# Altium project noeud_capteur_CWSB.PrjPcb
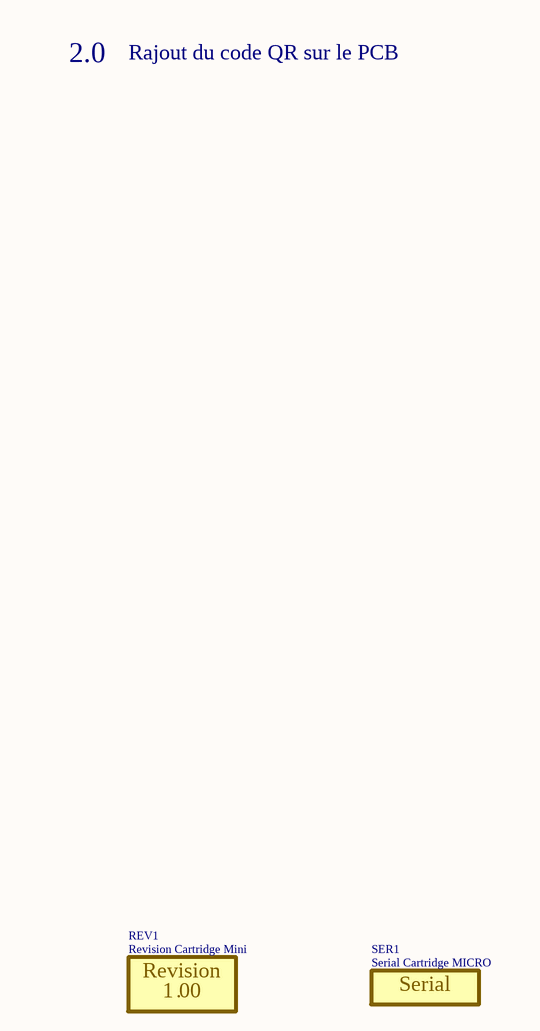
[diagram p0: NC_Title.SchDoc]
Projet_Concepteur1: William Champagne; Projet_Concepteur2: Bruno Savard; Projet_Date: 2026-08-24; Projet_nom_du_cours: CI3 (243-554-SH); Projet_PCB_Rev: 1; Projet_SCH_Rev: 00; Projet_stencil_Bot_epaisseur: 0.1 MM; Projet_stencil_Top_epaisseur: 0.1 MM; Projet_Titre: Noeud_capteurs_CWSB
5 sheets, 62 parts. Net scope: flat (ports and power ports of the same name join across sheets).
Board file: NC_PCB_4L.PcbDoc
Sheets:
  NC_Title.SchDoc
  NC_Overview.SchDoc
  NC_Connectors.SchDoc
  NC_Circuit.SchDoc
  NC_Alimentation.SchDoc

## Sheet NC_Title.SchDoc
size Tabloid; Date: Date; Author: Author 1; Revision: 1; SheetNumber: 1; SheetTotal: 5; Size: 11x17; Sheet_Name: Sheet Description

### Parts
REV1  Revision Cartridge Mini  [REV_REVISION_CARTRIDGE_MINI]  (no BOM)
SER1  Serial Cartridge MICRO  [SER_SERIAL_CARTRIDGE_MICRO]  (no BOM)

### Notes on the sheet
- 2.0
- Rajout du code QR sur le PCB
- Projet initial
- Historique de révision
- 1.0
- Légende
- Conversion des boitiers
- Notes Générales
- Métrique
- 1005
- 1608
- Impérial
- 0402
- 0603
- Revision
- .
- Notes PCB
- 2012
- 3216
- 0805
- 1206
- Notes Programmation
- 3225
- 6432
- 1210
- 2512
- Date :
- Variants
- RÉVISION & NUMÉRO DE SÉRIE
- Titre du projet
- Cours associé au projet
- Taille
- Département
- Technologies du
- Révision
- PCB
- SCH
- Date
- génie électrique
- Feuille
- Variant
- de
- Concepteurs
- (in symbol REV_REVISION_CARTRIDGE_MINI) Revision; .
- (in symbol SER_SERIAL_CARTRIDGE_MICRO) Serial

### Library data of the parts
REV1 = REV_REVISION_CARTRIDGE_MINI: REV - REVISION CARTRIDGE MINI; Rule: UNIONINDEX=0|RULEKIND=ComponentClearance|NETSCOPE=AnyNet|LAYERKIND=SameLayer|NAME=Schematic Component Clearance Constraint|GAP=0mil|COLLISIONCHECKMODE=3|VERTICALGAP=0mil|SHOWDISTANCES=FALSE|UNIT=Imperial; Rule: UNIONINDEX=0|RULEKIND=Clearance|NETSCOPE=DifferentNets|LAYERKIND=SameLayer|NAME=Schematic Clearance Constraint|GAP=10mil|GENERICCLEARANCE=10mil|IGNOREPADTOPADCLEARANCEINFOOTPRINT=FALSE|OBJECTCLEARANCES=ClearanceObj_Arc-ClearanceObj_Text:0;ClearanceObj_Track-ClearanceObj_Text:0;ClearanceObj_Text-ClearanceObj_Text:0|UNIT=Imperial; Value: *; Power Max: *; HelpURL: *; Package: *; Manufacturer #1: *; Note: *; Assembly Type: NONE; Part Number #1: *; Polarized: *; Supplier 1: *; Supplier Part Number 1: *
SER1 = SER_SERIAL_CARTRIDGE_MICRO: SER - SERIAL CARTRIDGE MICRO; Rule: UNIONINDEX=0|RULEKIND=ComponentClearance|NETSCOPE=AnyNet|LAYERKIND=SameLayer|NAME=Schematic Component Clearance Constraint|GAP=0mil|COLLISIONCHECKMODE=3|VERTICALGAP=0mil|SHOWDISTANCES=FALSE|UNIT=Imperial; Rule: UNIONINDEX=0|RULEKIND=Clearance|NETSCOPE=DifferentNets|LAYERKIND=SameLayer|NAME=Schematic Clearance Constraint|GAP=10mil|GENERICCLEARANCE=10mil|IGNOREPADTOPADCLEARANCEINFOOTPRINT=FALSE|OBJECTCLEARANCES=ClearanceObj_Arc-ClearanceObj_Text:0;ClearanceObj_Track-ClearanceObj_Text:0;ClearanceObj_Text-ClearanceObj_Text:0|UNIT=Imperial; Value: *; Power Max: *; HelpURL: *; Package: *; Manufacturer #1: *; Note: *; Assembly Type: NONE; Part Number #1: *; Polarized: *; Supplier 1: *; Supplier Part Number 1: *

## Sheet NC_Overview.SchDoc
size Tabloid; Date: Date; Author: Author 1; Revision: 1; SheetNumber: 2; SheetTotal: 5; Size: 11x17; Sheet_Name: Schéma fonctionnel

### Notes on the sheet
- Nom de la feuille
- Titre du projet
- Cours associé au projet
- Taille
- Département
- Technologies du
- Révision
- PCB
- .
- SCH
- Date
- génie électrique
- Feuille
- Variant
- de
- Concepteurs
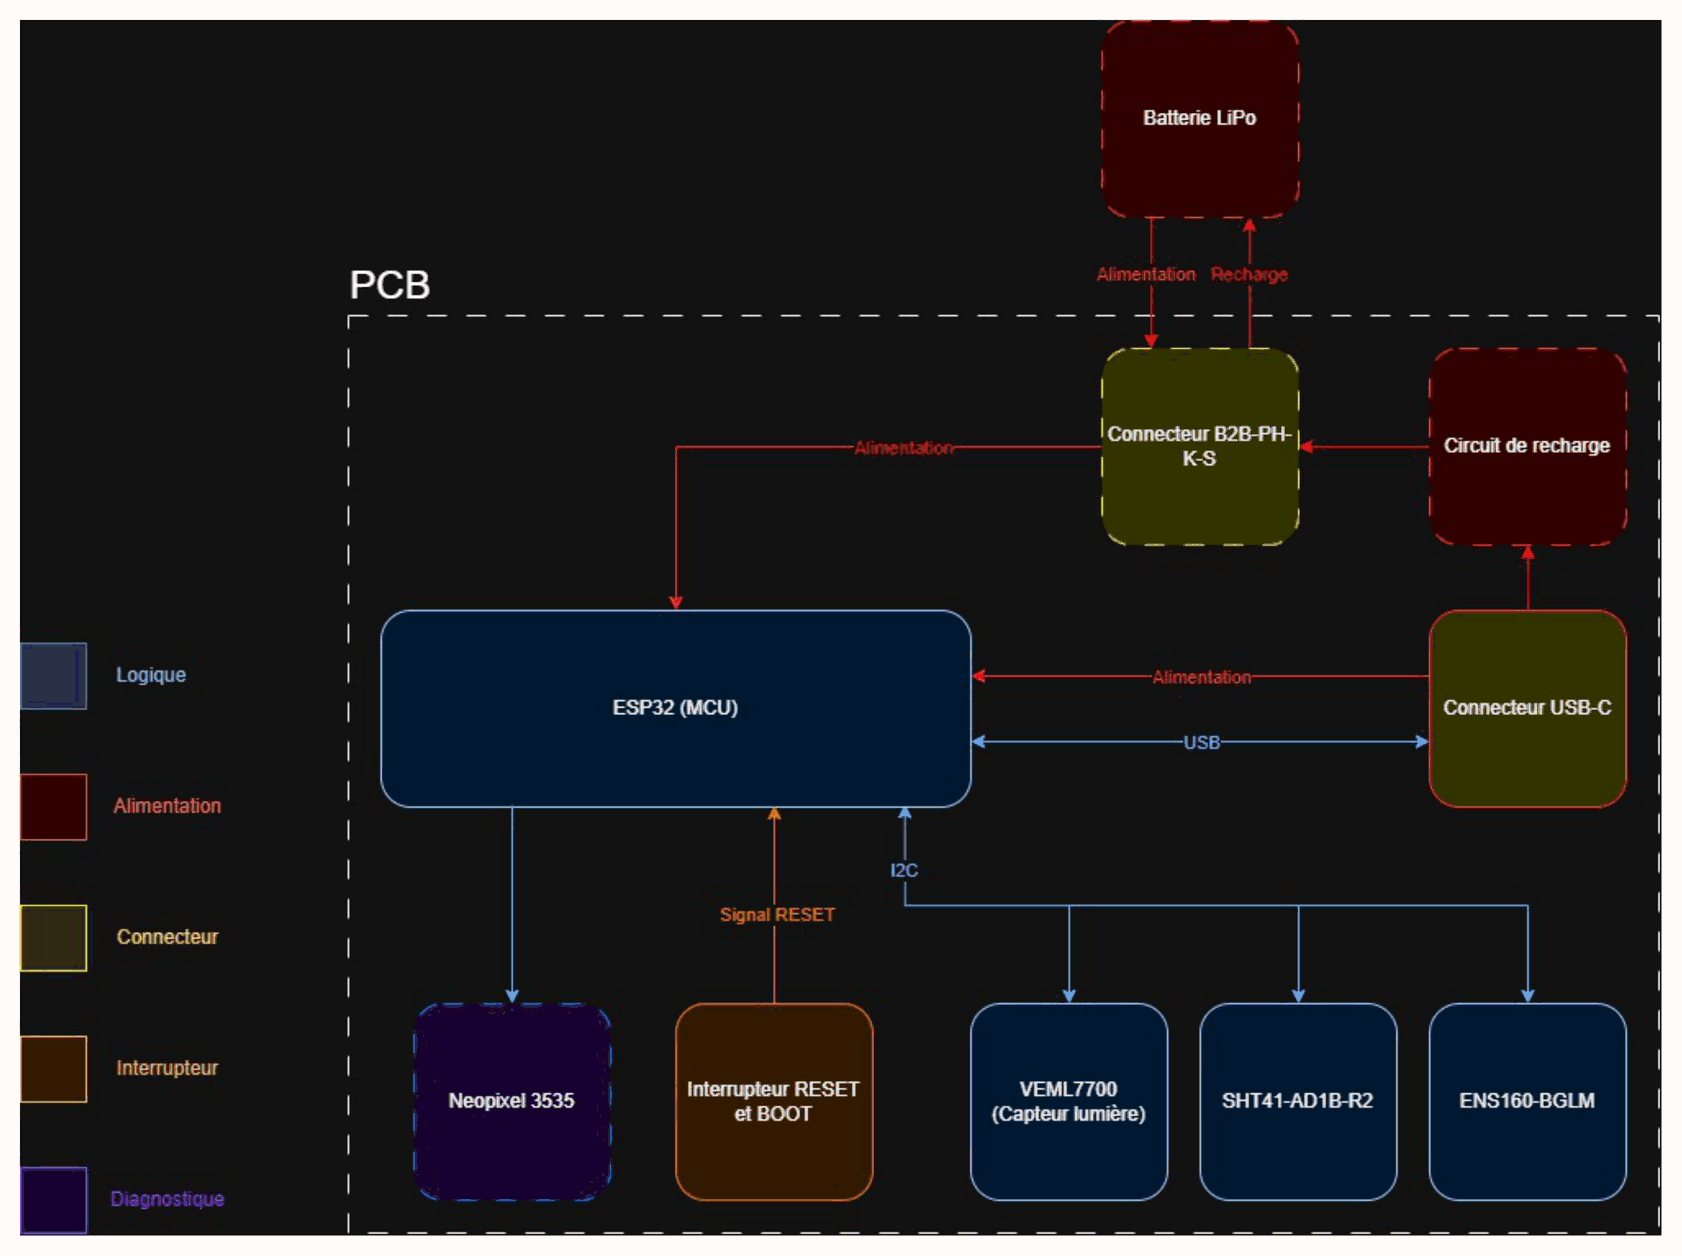
[diagram p1: NC_Overview.SchDoc]

## Sheet NC_Connectors.SchDoc
size Tabloid; SheetNumber: 3; SheetTotal: 5; Sheet_Name: Connecteurs; Size: 11x17
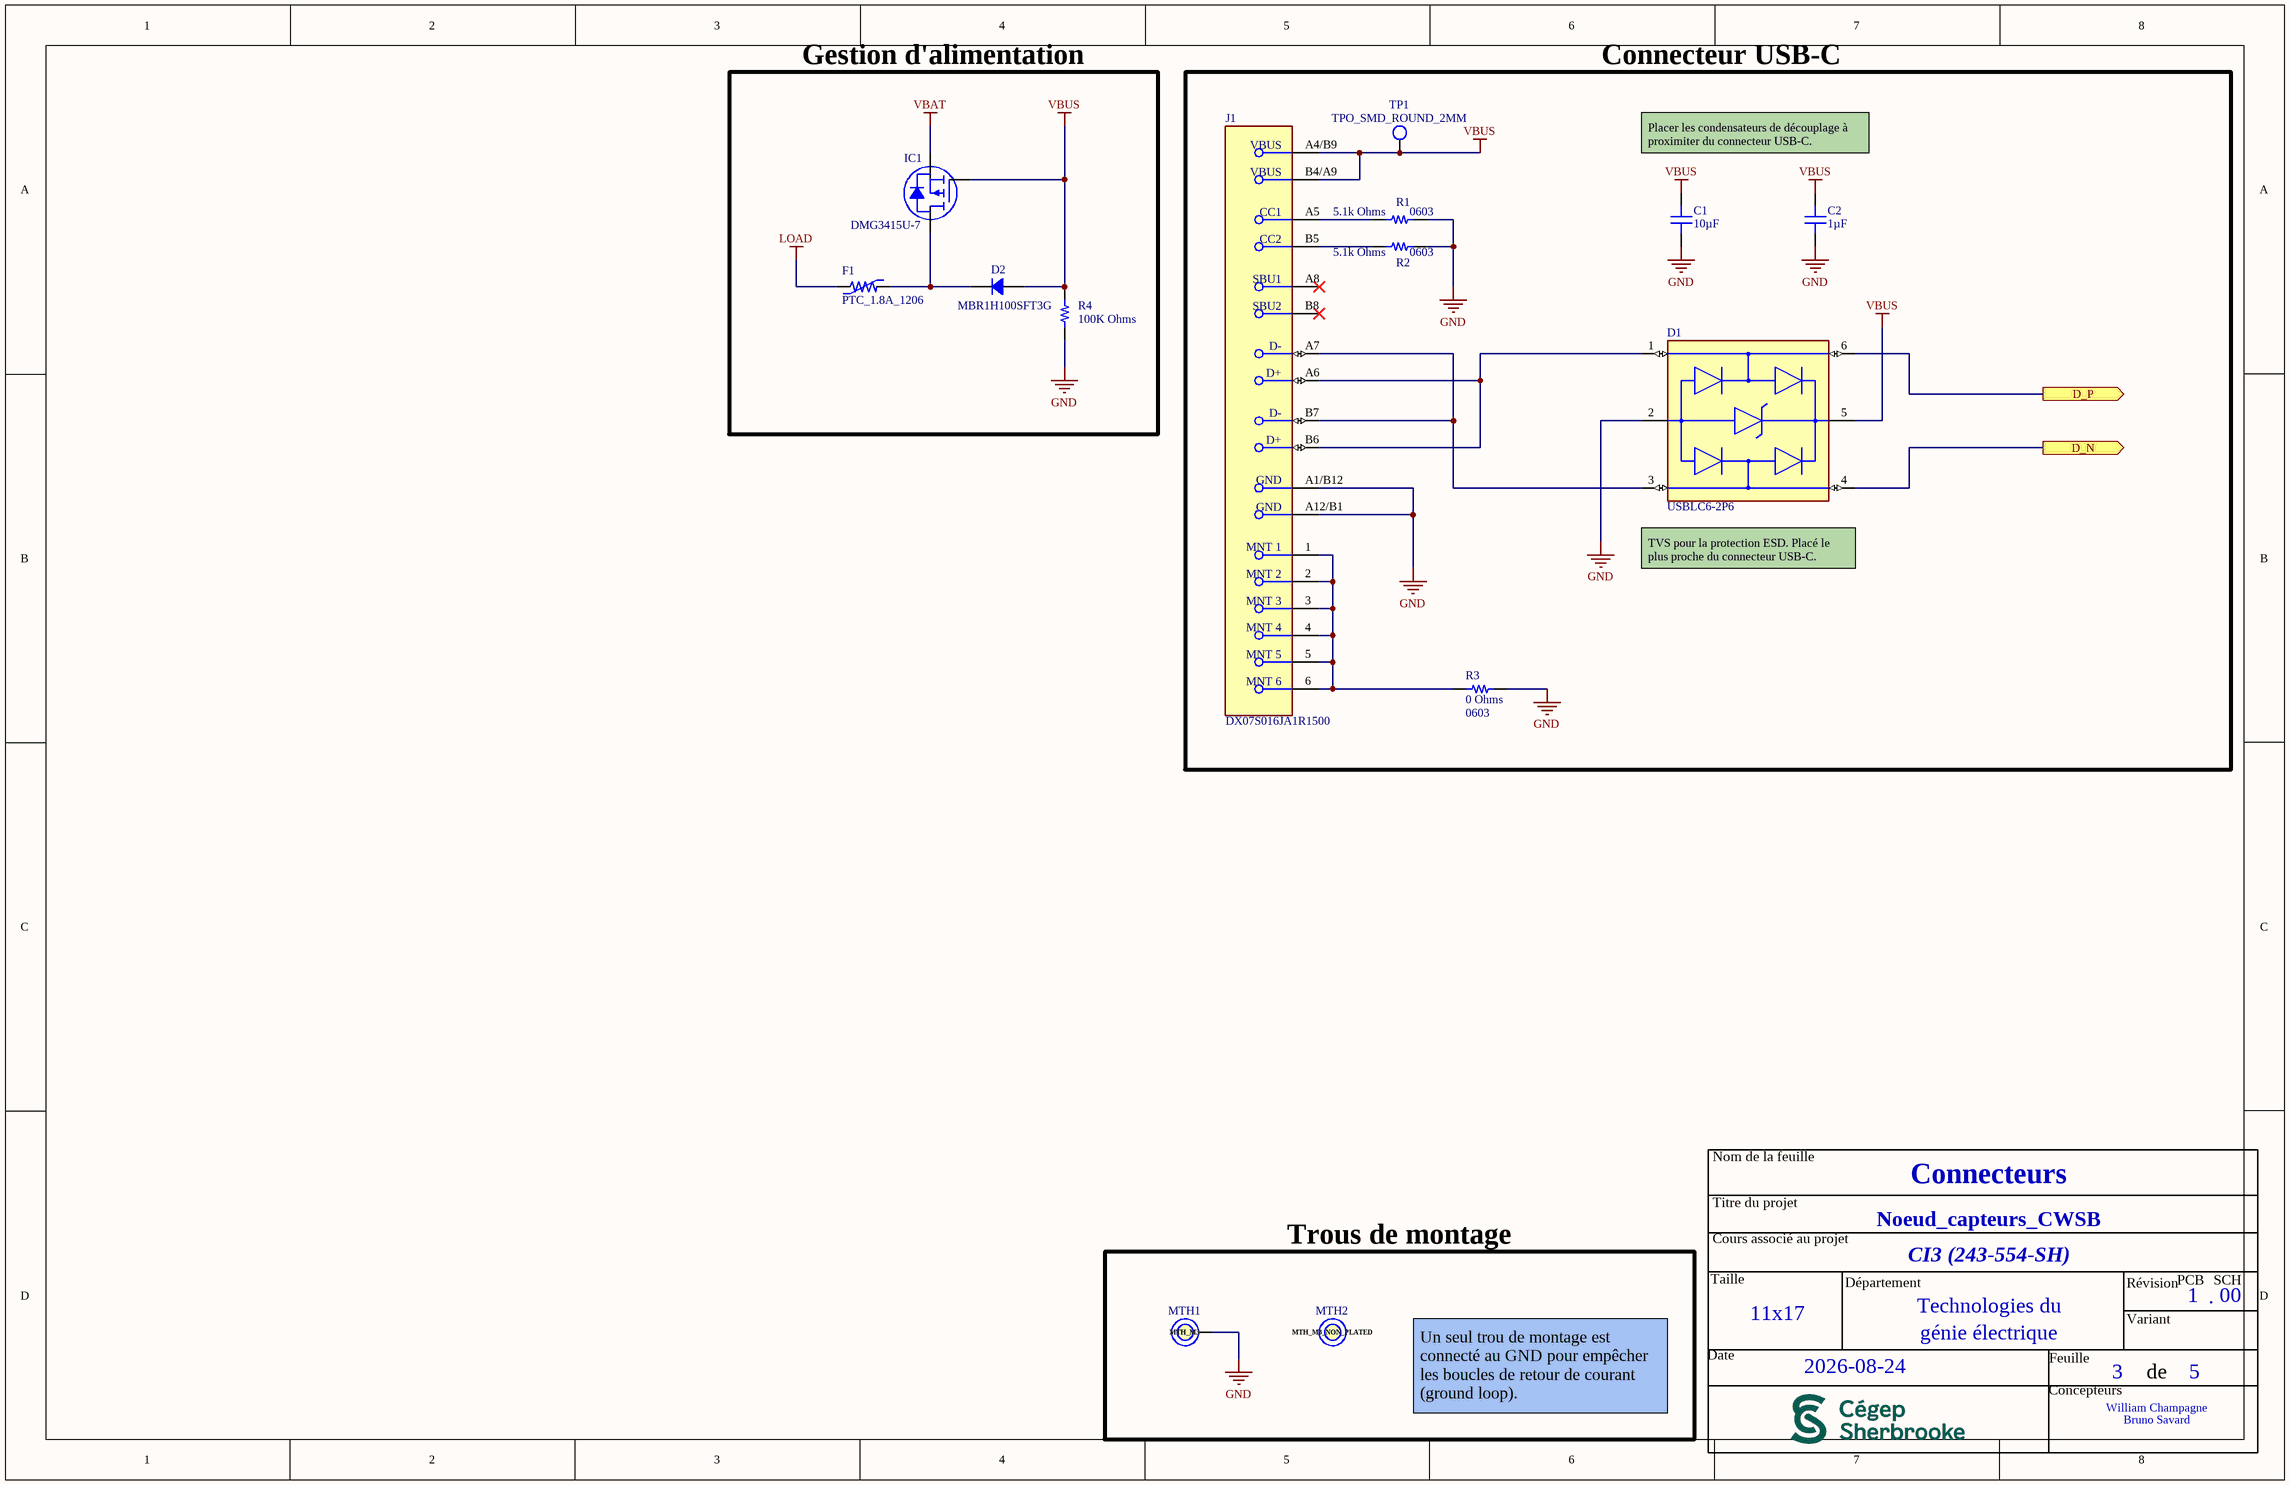
[diagram p2: NC_Connectors.SchDoc]

### Parts
C1  Capacitance: 10µF  [CAP 0603_1608]  (hidden comment: 1µF)
C2  1µF  [CAP 0603_1608]
D1  USBLC6-2P6  [FP-SOT-666-MFG]
D2  MBR1H100SFT3G  [SOD123F]
F1  PTC_1.8A_1206  [RESC3216X125N]
IC1  DMG3415U-7  [DIODES SOT-23-3]
J1  DX07S016JA1R1500  [FP-DX07S016JA1R1500-MFG]
MTH1  MTH_M3  [MTH_M3]  (no BOM)
MTH2  MTH_M3_NON_PLATED  [MTH_M3_NON_PLATED]  (no BOM)
R1  Supplier Device Package: 0603  [RES 0603_1608]  (hidden comment: 5.1k Ohms)
R2  Supplier Device Package: 0603  [RES 0603_1608]  (hidden comment: 5.1k Ohms)
R3  Supplier Device Package: 0603  [RES 0603_1608]  (hidden comment: 0 Ohms)
R4  100K Ohms  [RES 0603_1608]
TP1  TPO_SMD_ROUND_2MM  [TPO_SMD_ROUND_2MM]  (no BOM)

### Blocks framed on the sheet
Gestion d'alimentation: D2 F1 IC1 R4
Connecteur USB-C: C1 C2 D1 J1 R1-R3 TP1
Trous de montage: MTH1 MTH2

### Ports
D_N (out), D_P (out)

### Nets
GND: C1.1 C2.1 D1.2(GND) J1.A1/B12(GND) J1.A12/B1(GND) MTH1.1 R1.2 R2.2 R3.2 R4.1
LOAD: F1.1
VBAT: IC1.2(S)
VBUS: C1.2 C2.2 D1.5(VBUS) D2.1 IC1.1(G) J1.A4/B9(VBUS) J1.B4/A9(VBUS) R4.2 TP1.1
D_N: D1.4(I/O2) ; port D_N
D_P: D1.6(I/O1) ; port D_P
NetD1_1: D1.1(I/O1) J1.A6(D+) J1.B6(D+)
NetD1_3: D1.3(I/O2) J1.A7(D-) J1.B7(D-)
NetD2_2: D2.2 F1.2 IC1.3(D)
NetJ1_1: J1.1(MNT_1) J1.2(MNT_2) J1.3(MNT_3) J1.4(MNT_4) J1.5(MNT_5) J1.6(MNT_6) R3.1
NetJ1_A5: J1.A5(CC1) R1.1
NetJ1_B5: J1.B5(CC2) R2.1

Not connected (* = marked no-connect by the designer): J1 A8(SBU1)* B8(SBU2)*

### Notes on the sheet
- Placer les condensateurs de découplage à proximiter du connecteur USB-C.
- (near D1) TVS pour la protection ESD. Placé le plus proche du connecteur USB-C.
- Un seul trou de montage est connecté au GND pour empêcher les boucles de retour de courant (ground loop).
- Nom de la feuille
- Titre du projet
- Cours associé au projet
- Taille
- Département
- Technologies du
- Révision
- PCB
- .
- SCH
- Date
- génie électrique
- Feuille
- Variant
- de
- Concepteurs

### Library data of the parts
C1 C2 = 06035C105KAT2A: CAP CER 1UF 50V X7R 0603; manufacturer: AVX Corporation; Tolerance: ±10%; Part Number: 06035C105KAT2A; Applications: General Purpose; componentlink1description: Datasheet; componentlink1url: http://datasheets.avx.com/X7RDielectric.pdf; componentlink2description: DigiKey Link; componentlink2url: http://digikey.com/product-detail/en/avx-corporation/06035C105KAT2A/478-10073-1-ND/6564295; Device Package: 0603 (1608 Metric); lastupdated: 2020-09-02 1:03:35 AM; Lifecycle Status: Active; Minimum Order: 1; Mounting Type: Surface Mount, MLCC; Operating Temperature: -55°C ~ 125°C; Package / Case: 0603 (1608 Metric); packaging: TapeAndReel; partid: 2905; Part Status: Active; price: 0.15; series: -; Size / Dimension: 0.063" L x 0.032" W (1.60mm x 0.81mm); Supplier 1: DigiKey; Supplier Part Number 1: 478-10073-1-ND; Temperature Coefficient: X7R; Thickness (Max): 0.020" (0.50mm); value: 1µF; Voltage - Rated: 50V
  C2: Capacitance: 1µF
D1 = CMP-12225-000058-1: TVS DIODE 5.25V 17V SOT666; Min Breakdown Voltage: 6V; Power Line Protection: Yes; Element Configuration: Dual; Test Current: 1mA; Working Voltage: 5V; Number of Channels: 2; Max Reverse Leakage Current: 150nA; Direction: Unidirectional; Peak Pulse Current: 5A; Number of Elements: 1; Capacitance: 3.5pF; Max Breakdown Voltage: 6V; Height: 0.6mm; Depth: 1.3mm; Contact Plating: Tin; Reverse Breakdown Voltage: 6V; REACH SVHC: No SVHC; Operating Supply Voltage: 5V; Width: 1.3mm; Max Operating Temperature: 125°C; Reverse Standoff Voltage: 5V; ESD Protection: Yes; Package Quantity: 1; Termination: SMD/SMT; Length: 1.7mm; Leakage Current: 150nA; Number of Bidirectional Channels: 2; Case/Package: SOT-666; Min Operating Temperature: -40°C; Number of Pins: 6; Clamping Voltage: 17V; Breakdown Voltage: 6V; Lead Free: Lead Free; Radiation Hardening: No; Packaging: Tape and Reel; Mount: Surface Mount; Polarity: Unidirectional
D2 = MBR1H100SFT3G: DIODE SCHOTTKY 100V 1A SOD123FL; Manufacturer: ON Semiconductor; Current - Reverse Leakage @ Vr: 40µA @ 100V; Speed: Fast Recovery =< 500ns, > 200mA (Io); Voltage - Forward (Vf) (Max) @ If: 760mV @ 1A; Part Number: MBR1H100SFT3G; ComponentLink1Description: Datasheet; ComponentLink1URL: http://www.onsemi.com/pub/Collateral/MBR1H100SF-D.PDF; ComponentLink2Description: DigiKey Link; ComponentLink2URL: http://digikey.com/product-detail/en/on-semiconductor/MBR1H100SFT3G/MBR1H100SFT3GOSCT-ND/3462287; Current - Average Rectified (Io): 1A; Diode Type: Schottky; LastUpdated: 2026-04-05 8:31:56 PM; Lifecycle Status: Active; Minimum Order: 1; Mounting Type: Surface Mount; Operating Temperature - Junction: -65°C ~ 175°C; Package / Case: SOD-123F; Packaging: TapeAndReel; PartId: 2398; Part Status: Active; Price: 0.14; Series: -; Supplier 1: DigiKey; Supplier Part Number 1: MBR1H100SFT3GOSCT-ND; Supplier Device Package: SOD-123FL; Voltage - DC Reverse (Vr) (Max): 100V
F1 = CMP-005-000017-6: PTC Resettable Fuse 1A(hold) 1.8A(trip) 6VDC 100A 0.6W 0.3s 0.55Ohm SMD Solder Pad 1206 T/R Automotive; Resistance: 55mΩ; MF: Bel Fuse; Time to Trip: 300ms; Working Voltage: 6V; Maximum Resistance 1 Hour (R1max): 210mΩ; Package: 1206 Bel Fuse; China RoHS: Compliant; DigiKey-Purchase-URL: https://snapeda.com/shop?store=DigiKey&id=970476; Case Code (Imperial): 1206; Value: *; Price: None; Max Operating Temperature: 85°C; Lead Free: Lead Free; Availability: Good; Width: 1.8mm; Height: 1mm; REACH SVHC: Yes; Check_prices: https://www.snapeda.com/parts/0ZCJ0100FF2E/Bel%20Fuse%20Inc./view-part/970476/?ref=eda; Trip Current: 1.8A; Mouser-Purchase-URL: https://snapeda.com/shop?store=Mouser&id=970476; Design Item ID: 0ZCJ0100FF2E; Component Type: Standard; Number of Terminals: 2; Case Code (Metric): 3216; Mount: Surface Mount; MP: 0ZCJ0100FF2E; Min Operating Temperature: -40°C; SnapEDA_Link: https://www.snapeda.com/parts/0ZCJ0100FF2E/Bel%20Fuse%20Inc./view-part/970476/?ref=snap; Hold Current: 1A; Max Current Rating: 100A; Pin Count: 2; RoHS: Compliant; Source: 0ZCJ0100FF2E.SchLib; Lifecycle Status: Production; Case/Package: 1206; Packaging: Tape & Reel (TR)
IC1 = DMG3415U-7: MOSFET P-CH 20V 4A SOT23-3; Manufacturer: Diodes Incorporated; Current - Continuous Drain (Id) @ 25°C: 4A (Ta); Drive Voltage (Max Rds On,  Min Rds On): 1.8V, 4.5V; FET Type: P-Channel; Gate Charge (Qg) (Max) @ Vgs: 9.1 nC @ 4.5 V; Input Capacitance (Ciss) (Max) @ Vds: 294 pF @ 10 V; Power Dissipation (Max): 900mW (Ta); Rds On (Max) @ Id, Vgs: 39mOhm @ 4A, 4.5V; Vgs (Max): ±8V; Vgs(th) (Max) @ Id: 1V @ 250µA; Part Number: DMG3415U-7; ComponentLink1Description: Datasheet; ComponentLink1URL: //media.digikey.com/pdf/Data%20Sheets/Diodes%20PDFs/DMG3415U.pdf; ComponentLink2Description: DigiKey Link; ComponentLink2URL: https://www.digikey.com/en/products/detail/diodes-incorporated/DMG3415U-7/2052768; Drain to Source Voltage (Vdss): 20 V; LastUpdated: 2026-04-05 8:53:25 PM; Lifecycle Status: Active; Minimum Order: 1; Mounting Type: Surface Mount; Operating Temperature: -55°C ~ 150°C (TJ); Package / Case: TO-236-3, SC-59, SOT-23-3; Packaging: TapeAndReel; Part Status: Active; Price: 0.07; Series: -; Supplier 1: DigiKey; Supplier Part Number 1: DMG3415UDICT-ND; Supplier Device Package: SOT-23-3; Technology: MOSFET (Metal Oxide)
J1 = CMP-19038-000003-1: CONN RCP USB2.0 TYP C 24P SMD RA
MTH1 = CMP-006-000008-2: MTH - MOUNTING HOLE M3 PLATED - M3; Assembly Type: NONE; Component Type: Standard (No BOM); Manufacturer #1: *; Note: *; Polarized: *; Package: M3; Pin Count: 1; HelpURL: https://littlemachineshop.com/images/gallery/PDF/TapDrillSizes.pdf; Power Max: *; Value: *; Source: CEGEP_SHERBROOKE_TGE_LIBRARY.SchLib; Part Number #1: *; Design Item ID: MTH_M3
MTH2 = CMP-006-000010-2: MTH - MOUNTING HOLE M3 NON-PLATED - M3; Component Type: Standard (No BOM); Polarized: *; Package: M3; Note: *; Value: *; Power Max: *; Pin Count: 0; HelpURL: https://littlemachineshop.com/images/gallery/PDF/TapDrillSizes.pdf; Source: CEGEP_SHERBROOKE_TGE_LIBRARY.SchLib; Assembly Type: NONE; Part Number #1: *; Design Item ID: MTH_M3_NON_PLATED; Manufacturer #1: *
R1-R4 = ERJ-UP3J151V: RES 150 OHM 5% 1/4W 0603; Manufacturer: Panasonic Electronic Components; Power (Watts): 0.25W, 1/4W; Temperature Coefficient: ±200ppm/°C; Part Number: ERJ-UP3J151V; ComponentLink1Description: Datasheet; ComponentLink1URL: https://b2b-api.panasonic.eu/file_stream/pids/fileversion/4484; ComponentLink2Description: DigiKey Link; ComponentLink2URL: https://www.digikey.com/en/products/detail/panasonic-electronic-components/ERJ-UP3J151V/12092481; Composition: Thick Film; Device Package: 0603 (1608 Metric); Features: Anti-Sulfur, Automotive AEC-Q200, Pulse Withstanding; Height - Seated (Max): 0.022" (0.55mm); Lifecycle Status: Active; Minimum Order: 1; Number of Terminations: 2; Operating Temperature: -55°C ~ 155°C; Package / Case: 0603 (1608 Metric); Packaging: TapeAndReel; PartId: 63618; Part Status: Active; Price: 0.02; Ratings: AEC-Q200; Series: ERJ-UP3; Size / Dimension: 0.063" L x 0.031" W (1.60mm x 0.80mm); Supplier 1: DigiKey; Supplier Part Number 1: 10-ERJ-UP3J151VCT-ND; Tolerance: ±5%
  R1 R2: Value: 5.1k Ohms; LastUpdated: 2024-02-09 8:41:36 PM; Resistance: 5.1k Ohms
  R3: Value: 0 Ohms; LastUpdated: 2024-02-09 8:41:36 PM; Resistance: 0 Ohms
  R4: LastUpdated: 09/02/2024 20:41:36; Resistance: 100K Ohms; Supplier Device Package: 0603; Value: 100K Ohms
TP1 = CMP-007-000003-1: TPO - TEST POINT ROUND SMD PAD ONLY  - 2 MM; Component Type: Standard (No BOM); Polarized: *; Manufacturer #1: *; Part Number #1: *; HelpURL: *; Assembly Type: NONE; Source: CEGEP_SHERBROOKE_TGE_LIBRARY.SchLib; Design Item ID: TPO_SMD_ROUND_2MM; Pin Count: 1; Note: *; Value: *; Package: 2 MM ROUND; Power Max: *

## Sheet NC_Circuit.SchDoc
size Tabloid; Date: Date; Author: Author 1; Revision: 1; SheetNumber: 4; SheetTotal: 5; Size: 11x17; Sheet_Name: Circuit
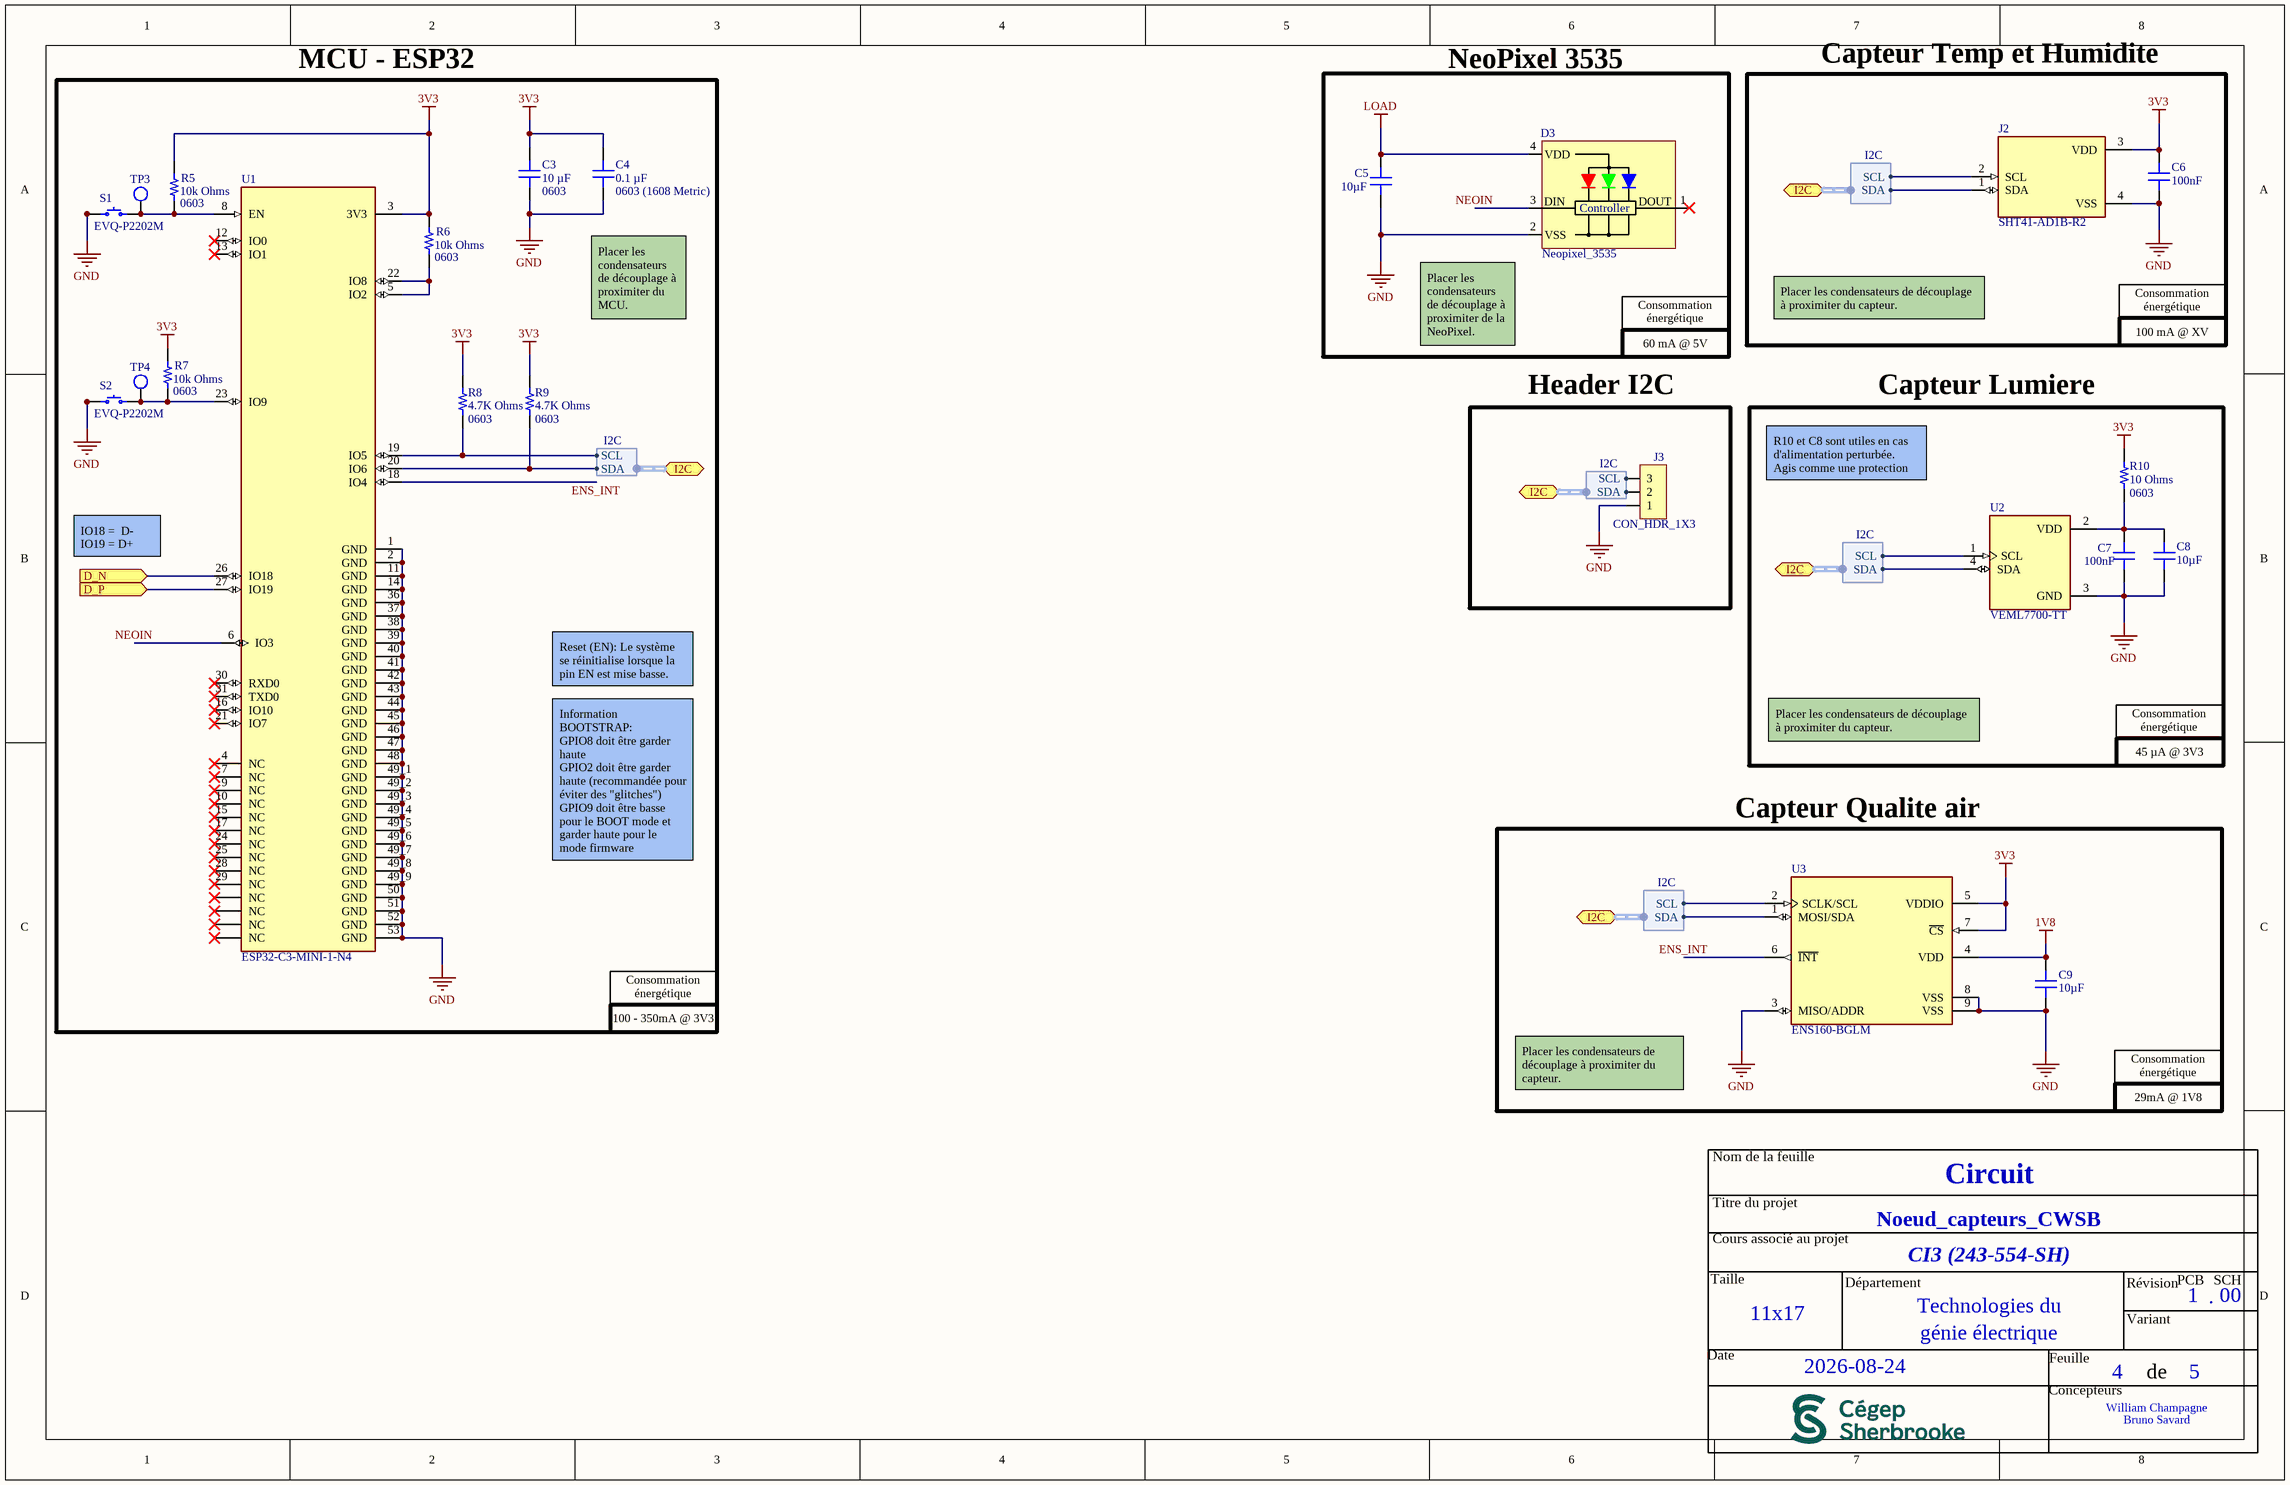
[diagram p3: NC_Circuit.SchDoc]

### Parts
C3  Device Package: 0603  [CAP 0603_1608]  (hidden comment: 10 µF)
C4  Device Package: 0603 (1608 Metric)  [CAP 0603_1608]  (hidden comment: 0.1 µF)
C5  Capacitance: 10µF  [CAP 0603_1608]  (hidden comment: 1µF)
C6  Capacitance: 100nF  [CAP 0603_1608]  (hidden comment: 1µF)
C7  Capacitance: 100nF  [CAP 0603_1608]  (hidden comment: 1µF)
C8  Capacitance: 10µF  [CAP 0603_1608]  (hidden comment: 1µF)
C9  Capacitance: 10µF  [CAP 0603_1608]  (hidden comment: 1µF)
D3  Neopixel_3535  [Neopixel_3535-Footprint-1]
J2  SHT41-AD1B-R2  [SHT4X]
J3  CON_HDR_1X3  [CON_HDR_1x3]
R5  Supplier Device Package: 0603  [RES 0603_1608]  (hidden comment: 10k Ohms)
R6  Supplier Device Package: 0603  [RES 0603_1608]  (hidden comment: 10k Ohms)
R7  Supplier Device Package: 0603  [RES 0603_1608]  (hidden comment: 10k Ohms)
R8  Supplier Device Package: 0603  [RES 0603_1608]  (hidden comment: 4.7K Ohms)
R9  Supplier Device Package: 0603  [RES 0603_1608]  (hidden comment: 4.7K Ohms)
R10  Supplier Device Package: 0603  [RES 0603_1608]  (hidden comment: 10 Ohms)
S1  EVQ-P2202M  [PANASONIC EVQP2]
S2  EVQ-P2202M  [PANASONIC EVQP2]
TP3  TPO_SMD_ROUND_2MM  [TPO_SMD_ROUND_2MM]  (value not drawn)  (no BOM)
TP4  TPO_SMD_ROUND_2MM  [TPO_SMD_ROUND_2MM]  (value not drawn)  (no BOM)
U1  ESP32-C3-MINI-1-N4  [XCVR_ESP32-C3-MINI-1-N4]
U2  VEML7700-TT  [XDCR_VEML7700-TT]
U3  ENS160-BGLM  [XDCR_ENS160-BGLM]

### Blocks framed on the sheet
MCU - ESP32: C3 C4 R5-R9 S1 S2 TP3 TP4 U1
NeoPixel 3535: C5 D3
Capteur Temp et Humidite: C6 J2
Header I2C: J3
Capteur Lumiere: C7 C8 R10 U2
Capteur Qualite air: C9 U3

### Ports
D_N (in), D_P (in), I2C (bidir, harness I2C)

### Harnesses
I2C: SCL, SDA

### Nets
1V8: C9.2 U3.4(VDD)
3V3: C3.2 C4.2 C6.2 J2.3(VDD) R5.1 R6.1 R7.1 R8.2 R9.2 R10.2 U1.3(3V3) U3.5(VDDIO) U3.7(~{CS})
GND: C3.1 C4.1 C5.1 C6.1 C7.1 C8.1 C9.1 D3.2(VSS) J2.4(VSS) J3.1 S1.1 S1.2 S2.1 S2.2 U1.1(GND) U1.2(GND) U1.11(GND) U1.14(GND) U1.36(GND) U1.37(GND) U1.38(GND) U1.39(GND) U1.40(GND) U1.41(GND) U1.42(GND) U1.43(GND) U1.44(GND) U1.45(GND) U1.46(GND) U1.47(GND) U1.48(GND) U1.49_1(GND) U1.49_2(GND) U1.49_3(GND) U1.49_4(GND) U1.49_5(GND) U1.49_6(GND) U1.49_7(GND) U1.49_8(GND) U1.49_9(GND) U1.50(GND) U1.51(GND) U1.52(GND) U1.53(GND) U2.3(GND) U3.3(MISO/ADDR) U3.8(VSS) U3.9(VSS)
LOAD: C5.2 D3.4(VDD)
D_N: U1.26(IO18) ; port D_N
D_P: U1.27(IO19) ; port D_P
ENS_INT: U1.18(IO4) U3.6(~{INT})
NEOIN: D3.3(DIN) U1.6(IO3)
NetC7_2: C7.2 C8.2 R10.1 U2.2(VDD)
NetJ2_1: J2.1(SDA) J3.2 R9.1 U1.20(IO6) U2.4(SDA) U3.1(MOSI/SDA) ; port I2C.SDA
NetJ2_2: J2.2(SCL) J3.3 R8.1 U1.19(IO5) U2.1(SCL) U3.2(SCLK/SCL) ; port I2C.SCL
NetR5_2: R5.2 S1.3 S1.4 TP3.1 U1.8(EN)
NetR6_2: R6.2 U1.5(IO2) U1.22(IO8)
NetR7_2: R7.2 S2.3 S2.4 TP4.1 U1.23(IO9)

Not connected (* = marked no-connect by the designer): D3 1(DOUT)*; U1 4(NC)* 7(NC)* 9(NC)* 10(NC)* 12(IO0)* 13(IO1)* 15(NC)* 16(IO10)* 17(NC)* 21(IO7)* 24(NC)* 25(NC)* 28(NC)* 29(NC)* 30(RXD0)* 31(TXD0)* 32(NC)* 33(NC)* 34(NC)* 35(NC)*

### Notes on the sheet
- (near C4) Placer les condensateurs de découplage à proximiter du MCU.
- (near D3) Placer les condensateurs de découplage à proximiter de la NeoPixel.
- Consommation énergétique
- 60 mA @ 5V
- Placer les condensateurs de découplage à proximiter du capteur.
- 100 mA @ XV
- R10 et C8 sont utiles en cas d'alimentation perturbée. Agis comme une protection supplémentaire
- IO18 =  D-
  IO19 = D+
- Reset (EN): Le système se réinitialise lorsque la pin EN est mise basse.
- 45 µA @ 3V3
- Information BOOTSTRAP:
  GPIO8 doit être garder haute
  GPIO2 doit être garder haute (recommandée pour éviter des "glitches")
  GPIO9 doit être basse pour le BOOT mode et garder haute pour le mode firmware
- 100 - 350mA @ 3V3
- 29mA @ 1V8
- Nom de la feuille
- Titre du projet
- Cours associé au projet
- Taille
- Département
- Technologies du
- Révision
- PCB
- .
- SCH
- Date
- génie électrique
- Feuille
- Variant
- de
- Concepteurs
- (in symbol CMP-851-000001-3) Controller

### Library data of the parts
C3 = GRM188R60J106ME47D: CAP CER 10UF 6.3V X5R 0603; manufacturer: Murata Electronics; Tolerance: ±20%; Part Number: GRM188R60J106ME47D; Capacitance: 10 µF; Applications: General Purpose; componentlink1description: Datasheet; componentlink1url: https://www.murata.com/~/media/webrenewal/support/library/catalog/products/capacitor/mlcc/c02e.ashx?la=en-us; componentlink2description: DigiKey Link; componentlink2url: https://www.digikey.com/en/products/detail/murata-electronics/GRM188R60J106ME47D/965910; lastupdated: 06/04/2026 19:23:52; Lifecycle Status: Active; Minimum Order: 1; Mounting Type: Surface Mount, MLCC; Operating Temperature: -55°C ~ 85°C; Package / Case: 0603 (1608 Metric); packaging: TapeAndReel; partid: 2351; Part Status: Active; price: 0.01; series: GRM; Size / Dimension: 0.063" L x 0.031" W (1.60mm x 0.80mm); Supplier 1: DigiKey; Supplier Part Number 1: 490-3896-1-ND; Temperature Coefficient: X5R; Thickness (Max): 0.035" (0.90mm); value: 10 µF; Voltage - Rated: 6.3V
C4 = 6R3X14W104MV4T: CAP CER 0.1UF 6.3V X7R 0603; manufacturer: Johanson Dielectrics Inc.; Tolerance: ±20%; Part Number: 6R3X14W104MV4T; Capacitance: 0.1 µF; Applications: Bypass, Decoupling; componentlink1description: Datasheet; componentlink1url: https://www.johansondielectrics.com/downloads/x2y-filter-and-decoupling-capacitors.pdf; componentlink2description: DigiKey Link; componentlink2url: https://www.digikey.com/en/products/detail/johanson-dielectrics-inc/6R3X14W104MV4T/1556331; lastupdated: 06/04/2026 19:23:51; Lifecycle Status: Active; Minimum Order: 1; Mounting Type: Surface Mount, MLCC; Operating Temperature: -55°C ~ 125°C; Package / Case: 0603 (1608 Metric); packaging: TapeAndReel; partid: 2650; Part Status: Active; price: 0.08; series: X2Y®; Size / Dimension: 0.064" L x 0.035" W (1.63mm x 0.89mm); Supplier 1: DigiKey; Supplier Part Number 1: 709-1009-1-ND; Temperature Coefficient: X7R; Thickness (Max): 0.026" (0.66mm); value: 0.1 µF; Voltage - Rated: 6.3V; Features: Low ESL (X2Y)
C5-C9 = 06035C105KAT2A: as C1 on sheet NC_Connectors; Part Number: 06035C105KAT2A; Applications: General Purpose; componentlink1description: Datasheet; componentlink1url: http://datasheets.avx.com/X7RDielectric.pdf; componentlink2description: DigiKey Link; componentlink2url: http://digikey.com/product-detail/en/avx-corporation/06035C105KAT2A/478-10073-1-ND/6564295; Device Package: 0603 (1608 Metric); lastupdated: 2020-09-02 1:03:35 AM; Lifecycle Status: Active; Minimum Order: 1; Mounting Type: Surface Mount, MLCC; Operating Temperature: -55°C ~ 125°C; Package / Case: 0603 (1608 Metric); packaging: TapeAndReel; partid: 2905; Part Status: Active; price: 0.15; series: -; Size / Dimension: 0.063" L x 0.032" W (1.60mm x 0.81mm); Supplier 1: DigiKey; Supplier Part Number 1: 478-10073-1-ND; Temperature Coefficient: X7R; Thickness (Max): 0.020" (0.50mm); value: 1µF; Voltage - Rated: 50V
D3 = CMP-851-000001-3: Neopixel Mini 3535 Rgb Leds W/ Integrated Driver Chip - White - Pack Of 10
J2 = SHT41-AD1B-R2: Digital Relative Humidity Temperature Sensor, Â±1.8 / max 2.5 %RH, Â±0.2 Â°C, Ultra-Low-Power, with filtermembrane; MF: Sensirion; SnapEDA_Link: https://www.snapeda.com/parts/SHT41-AD1B-R2/Sensirion/view-part/?ref=snap; Purchase-URL: https://pricing.snapeda.com/search/part/SHT41-AD1B-R2/?ref=eda; Package: Package; MP: SHT41-AD1B-R2; Price: None; Availability: In Stock; Check_prices: https://www.snapeda.com/parts/SHT41-AD1B-R2/Sensirion/view-part/?ref=eda; Value: *
J3 = CMP-005-000001-1: CON - Header 1x3 pins-100Mils - TH; Polarized: No; Source: CEGEP_SHERBROOKE_TGE_LIBRARY.SchLib; Component Type: Standard; Package: TH; Power Max: *; Pin Count: 3; Design Item ID: CON_HDR_1X3; Note: *; Manufacturer #1: *; HelpURL: *; Assembly Type: TH
R5-R7 = ERJ-UP3J151V: RES 150 OHM 5% 1/4W 0603; Manufacturer: Panasonic Electronic Components; Power (Watts): 0.25W, 1/4W; Resistance: 150 Ohms; Temperature Coefficient: ±200ppm/°C; Part Number: ERJ-UP3J151V; Value: 10k Ohms; ComponentLink1Description: Datasheet; ComponentLink1URL: https://b2b-api.panasonic.eu/file_stream/pids/fileversion/4484; ComponentLink2Description: DigiKey Link; ComponentLink2URL: https://www.digikey.com/en/products/detail/panasonic-electronic-components/ERJ-UP3J151V/12092481; Composition: Thick Film; Device Package: 0603 (1608 Metric); Features: Anti-Sulfur, Automotive AEC-Q200, Pulse Withstanding; Height - Seated (Max): 0.022" (0.55mm); LastUpdated: 2024-02-09 8:41:36 PM; Lifecycle Status: Active; Minimum Order: 1; Number of Terminations: 2; Operating Temperature: -55°C ~ 155°C; Package / Case: 0603 (1608 Metric); Packaging: TapeAndReel; PartId: 63618; Part Status: Active; Price: 0.02; Ratings: AEC-Q200; Series: ERJ-UP3; Size / Dimension: 0.063" L x 0.031" W (1.60mm x 0.80mm); Supplier 1: DigiKey; Supplier Part Number 1: 10-ERJ-UP3J151VCT-ND; Tolerance: ±5%
R8-R10 = ERJ-UP3J151V: RES 150 OHM 5% 1/4W 0603; Manufacturer: Panasonic Electronic Components; Power (Watts): 0.25W, 1/4W; Resistance: 5.1k Ohms; Temperature Coefficient: ±200ppm/°C; Part Number: ERJ-UP3J151V; ComponentLink1Description: Datasheet; ComponentLink1URL: https://b2b-api.panasonic.eu/file_stream/pids/fileversion/4484; ComponentLink2Description: DigiKey Link; ComponentLink2URL: https://www.digikey.com/en/products/detail/panasonic-electronic-components/ERJ-UP3J151V/12092481; Composition: Thick Film; Device Package: 0603 (1608 Metric); Features: Anti-Sulfur, Automotive AEC-Q200, Pulse Withstanding; Height - Seated (Max): 0.022" (0.55mm); LastUpdated: 2024-02-09 8:41:36 PM; Lifecycle Status: Active; Minimum Order: 1; Number of Terminations: 2; Operating Temperature: -55°C ~ 155°C; Package / Case: 0603 (1608 Metric); Packaging: TapeAndReel; PartId: 63618; Part Status: Active; Price: 0.02; Ratings: AEC-Q200; Series: ERJ-UP3; Size / Dimension: 0.063" L x 0.031" W (1.60mm x 0.80mm); Supplier 1: DigiKey; Supplier Part Number 1: 10-ERJ-UP3J151VCT-ND; Tolerance: ±5%
  R8 R9: Value: 4.7K Ohms
  R10: Value: 10 Ohms
S1 S2 = EVQ-P2202M: SWITCH TACTILE SPST-NO 0.02A 15V; Part Number: EVQ-P2202M
TP3 TP4 = CMP-007-000003-1: as TP1 on sheet NC_Connectors; Component Type: Standard (No BOM); Polarized: *; Manufacturer #1: *; Part Number #1: *; HelpURL: *; Assembly Type: NONE; Source: CEGEP_SHERBROOKE_TGE_LIBRARY.SchLib; Design Item ID: TPO_SMD_ROUND_2MM; Pin Count: 1; Note: *; Value: *; Package: 2 MM ROUND; Power Max: *
U1 = ESP32-C3-MINI-1-N4: MF: {'manufacturer': u'Espressif Systems'}; Package: None; Price: None; Value: *; MP: ESP32-C3-MINI-1-N4; Availability: Unavailable
U2 = VEML7700-TT: Optical Sensor Ambient - IÂ²C 4-SMD, J-Lead; MF: Vishay Semiconductor; SnapEDA_Link: https://www.snapeda.com/parts/VEML7700-TT/Vishay/view-part/?ref=snap; Package: SMD-4 Vishay Semiconductor; Value: *; MP: VEML7700-TT; Check_prices: https://www.snapeda.com/parts/VEML7700-TT/Vishay/view-part/?ref=eda
U3 = ENS160-BGLM: Air Quality, Carbon Dioxide (CO2), Metal Oxide (MOX) Sensor IÂ²C, SPI; MF: ScioSense; SnapEDA_Link: https://www.snapeda.com/parts/ENS160-BGLM/ScioSense/view-part/?ref=snap; Package: LGA-9 ScioSense; Value: *; MP: ENS160-BGLM; Check_prices: https://www.snapeda.com/parts/ENS160-BGLM/ScioSense/view-part/?ref=eda

## Sheet NC_Alimentation.SchDoc
size A4; SheetNumber: 5; SheetTotal: 5
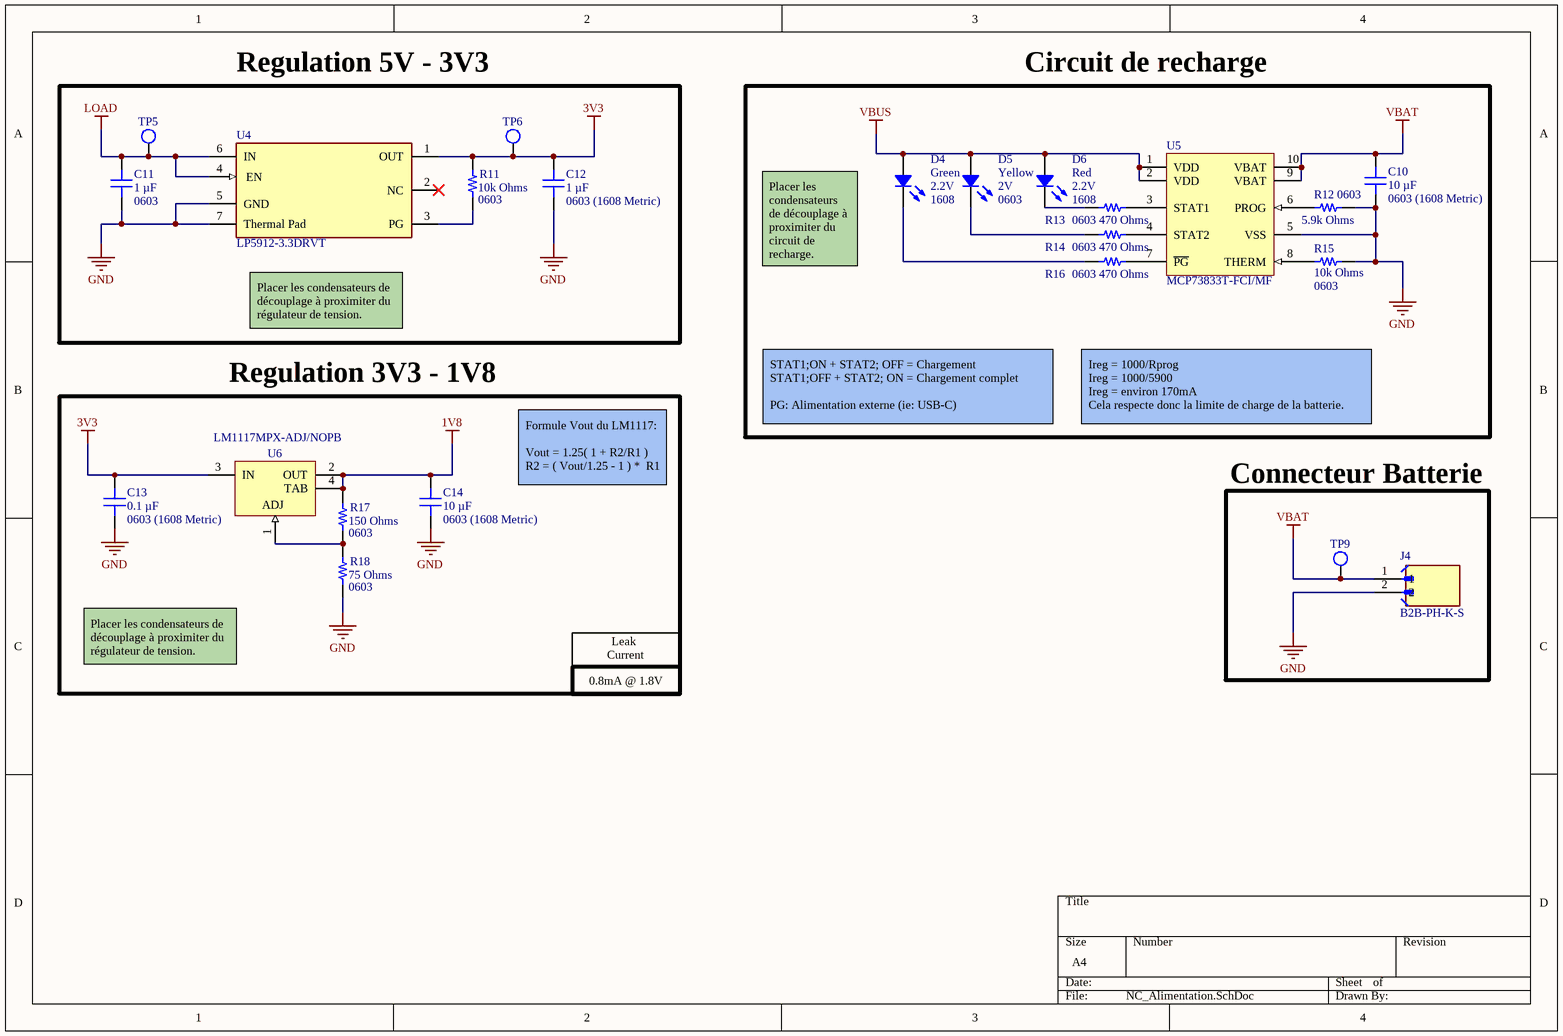
[diagram p4: NC_Alimentation.SchDoc]

### Parts
C10  Device Package: 0603 (1608 Metric)  [CAP 0603_1608]  (hidden comment: 10 µF)
C11  Device Package: 0603  [CAP 0603_1608]  (hidden comment: 1 µF)
C12  Device Package: 0603 (1608 Metric)  [CAP 0603_1608]  (hidden comment: 1 µF)
C13  Device Package: 0603 (1608 Metric)  [CAP 0603_1608]  (hidden comment: 0.1 µF)
C14  Device Package: 0603 (1608 Metric)  [CAP 0603_1608]  (hidden comment: 10 µF)
D4  Green  Supplier Device Package: 1608  Voltage - Forward (Vf) (Typ): 2.2V  [LED 0603_1608 GREEN]
D5  Yellow  Device Package: 0603  Voltage - Forward (Vf) (Typ): 2V  [LED 0603_1608 YELLOW]
D6  Red  Supplier Device Package: 1608  Voltage - Forward (Vf) (Typ): 2.2V  [LED 0603_1608 RED]
J4  B2B-PH-K-S  [JST_B2B-PH-K-S]
R11  Supplier Device Package: 0603  [RES 0603_1608]  (hidden comment: 10k Ohms)
R12  Supplier Device Package: 0603  [RES 0603_1608]  (hidden comment: 5.9k Ohms)
R13  Supplier Device Package: 0603  [RES 0603_1608]  (hidden comment: 470 Ohms)
R14  Supplier Device Package: 0603  [RES 0603_1608]  (hidden comment: 470 Ohms)
R15  Supplier Device Package: 0603  [RES 0603_1608]  (hidden comment: 10k Ohms)
R16  Supplier Device Package: 0603  [RES 0603_1608]  (hidden comment: 470 Ohms)
R17  Supplier Device Package: 0603  [RES 0603_1608]  (hidden comment: 150 Ohms)
R18  Supplier Device Package: 0603  [RES 0603_1608]  (hidden comment: 75 Ohms)
TP5  TPO_SMD_ROUND_2MM  [TPO_SMD_ROUND_2MM]  (value not drawn)  (no BOM)
TP6  TPO_SMD_ROUND_2MM  [TPO_SMD_ROUND_2MM]  (value not drawn)  (no BOM)
TP9  TPO_SMD_ROUND_2MM  [TPO_SMD_ROUND_2MM]  (value not drawn)  (no BOM)
U4  LP5912-3.3DRVT  [FP-DRV0006A-IPC_C]
U5  MCP73833T-FCI/MF  [DFN-MF10]
U6  LM1117MPX-ADJ/NOPB  [DCY0004A_N]

### Blocks framed on the sheet
Regulation 5V - 3V3: C11 C12 R11 TP5 TP6 U4
Circuit de recharge: C10 D4-D6 R12-R16 U5
Regulation 3V3 - 1V8: C13 C14 R17 R18 U6
Connecteur Batterie: J4 TP9

### Nets
1V8: C14.2 R17.1 U6.2(OUT) U6.4(TAB)
3V3: C12.2 C13.2 R11.1 TP6.1 U4.1(OUT) U6.3(IN)
GND: C10.1 C11.1 C12.1 C13.1 C14.1 J4.2 R12.2 R15.1 R18.2 U4.5(GND) U4.7(Thermal_Pad) U5.5(VSS)
LOAD: C11.2 TP5.1 U4.4(EN) U4.6(IN)
VBAT: C10.2 J4.1 TP9.1 U5.9(VBAT) U5.10(VBAT)
VBUS: D4.1 D5.1 D6.1 U5.1(VDD) U5.2(VDD)
NetD4_2: D4.2 R16.2
NetD5_2: D5.2 R14.2
NetD6_2: D6.2 R13.2
NetR11_2: R11.2 U4.3(PG)
NetR12_1: R12.1 U5.6(PROG)
NetR13_1: R13.1 U5.3(STAT1)
NetR14_1: R14.1 U5.4(STAT2)
NetR15_2: R15.2 U5.8(THERM)
NetR16_1: R16.1 U5.7(~{PG})
NetR17_2: R17.2 R18.1 U6.1(ADJ)

Not connected (* = marked no-connect by the designer): U4 2(NC)*

### Notes on the sheet
- (near D4) Placer les condensateurs de découplage à proximiter du circuit de recharge.
- (near U4) Placer les condensateurs de découplage à proximiter du régulateur de tension.
- STAT1;ON + STAT2; OFF = Chargement
  STAT1;OFF + STAT2; ON = Chargement complet
  PG: Alimentation externe (ie: USB-C)
- Ireg = 1000/Rprog
  Ireg = 1000/5900
  Ireg = environ 170mA
  Cela respecte donc la limite de charge de la batterie.
- Formule Vout du LM1117:
  Vout = 1.25( 1 + R2/R1 )
  R2 = ( Vout/1.25 - 1 ) *  R1
- Placer les condensateurs de découplage à proximiter du régulateur de tension.
- Leak
  Current
- 0.8mA @ 1.8V

### Library data of the parts
C10 C14 = GRM188R60J106ME47D: as C3 on sheet NC_Circuit; Part Number: GRM188R60J106ME47D; Capacitance: 10 µF; Applications: General Purpose; componentlink1description: Datasheet; componentlink1url: https://www.murata.com/~/media/webrenewal/support/library/catalog/products/capacitor/mlcc/c02e.ashx?la=en-us; componentlink2description: DigiKey Link; componentlink2url: https://www.digikey.com/en/products/detail/murata-electronics/GRM188R60J106ME47D/965910; lastupdated: 06/04/2026 19:23:52; Lifecycle Status: Active; Minimum Order: 1; Mounting Type: Surface Mount, MLCC; Operating Temperature: -55°C ~ 85°C; Package / Case: 0603 (1608 Metric); packaging: TapeAndReel; partid: 2351; Part Status: Active; price: 0.01; series: GRM; Size / Dimension: 0.063" L x 0.031" W (1.60mm x 0.80mm); Supplier 1: DigiKey; Supplier Part Number 1: 490-3896-1-ND; Temperature Coefficient: X5R; Thickness (Max): 0.035" (0.90mm); value: 10 µF; Voltage - Rated: 6.3V
C11 C12 = C0603C105K4RACAUTO: CAP CER 1UF 16V X7R 0603; manufacturer: KEMET; Tolerance: ±10%; Part Number: C0603C105K4RACAUTO; Capacitance: 1 µF; Applications: Automotive, Bypass, Decoupling; componentlink1description: Datasheet; componentlink1url: https://api.kemet.com/component-edge/download/datasheet/C0603C105K4RACAUTO.pdf; componentlink2description: DigiKey Link; componentlink2url: https://www.digikey.com/en/products/detail/kemet/C0603C105K4RACAUTO/8635831; lastupdated: 06/04/2026 19:23:53; Lifecycle Status: Active; Minimum Order: 1; Mounting Type: Surface Mount, MLCC; Operating Temperature: -55°C ~ 125°C; Package / Case: 0603 (1608 Metric); packaging: TapeAndReel; partid: 2179; Part Status: Active; price: 0.02; series: SMD Auto X7R; Size / Dimension: 0.063" L x 0.031" W (1.60mm x 0.80mm); Supplier 1: DigiKey; Supplier Part Number 1: 399-17704-1-ND; Temperature Coefficient: X7R; Thickness (Max): 0.037" (0.95mm); value: 1 µF; Voltage - Rated: 16V; Ratings: AEC-Q200
C13 = CS0603KRX7R7BB104: CAP CER 0.1UF 16V X7R 0603; manufacturer: Yageo; Tolerance: ±10%; Part Number: CS0603KRX7R7BB104; Capacitance: 0.1 µF; Applications: Boardflex Sensitive; componentlink1description: Datasheet; componentlink1url: http://www.yageo.com/NewPortal/yageodocoutput?fileName=/pdf/MLCC/UPY-ST_NPOX7R_16V-to-3KV_5.pdf; componentlink2description: DigiKey Link; componentlink2url: https://www.digikey.com/en/products/detail/yageo/CS0603KRX7R7BB104/6097897; lastupdated: 06/04/2026 19:23:52; Lifecycle Status: Active; Minimum Order: 1; Mounting Type: Surface Mount, MLCC; Operating Temperature: -55°C ~ 125°C; Package / Case: 0603 (1608 Metric); packaging: TapeAndReel; partid: 2286; Part Status: Active; price: 0.02; series: CS; Size / Dimension: 0.063" L x 0.031" W (1.60mm x 0.80mm); Supplier 1: DigiKey; Supplier Part Number 1: 311-3560-1-ND; Temperature Coefficient: X7R; Thickness (Max): 0.037" (0.95mm); value: 0.1 µF; Voltage - Rated: 16V; Features: Soft Termination
D4 = SML-D12P8WT86: LED GREEN DIFFUSED 0603 SMD; Manufacturer: Rohm Semiconductor; Configuration: Standard; Current - Test: 20mA; Lens Color: White; Lens Size: 1.20mm x 0.80mm; Lens Style: Rectangle with Flat Top; Millicandela Rating: 6.3mcd; Wavelength - Dominant: 560nm; Part Number: SML-D12P8WT86; Color: Green; ComponentLink1Description: Datasheet; ComponentLink1URL: https://www.rohm.com/datasheet/SML-D12V8W; ComponentLink2Description: DigiKey Link; ComponentLink2URL: https://www.digikey.com/en/products/detail/rohm-semiconductor/SML-D12P8WT86/1641798; Device Package: 0603 (1608 Metric); Height (Max): 0.65mm; LastUpdated: 2024-03-11 7:51:11 AM; Lens Transparency: Diffused; Lifecycle Status: Active; Minimum Order: 1; Mounting Type: Surface Mount; Package / Case: 0603 (1608 Metric); Packaging: TapeAndReel; PartId: 616; Part Status: Active; Price: 0.03; Series: EXCELED™; Size / Dimension: 1.60mm L x 0.80mm W; Supplier 1: DigiKey; Supplier Part Number 1: 511-1579-1-ND; Value: Green
D5 = SML-511WWT86: LED YELLOW DIFFUSED 0603 SMD; Manufacturer: Rohm Semiconductor; Configuration: Standard; Current - Test: 20mA; Lens Color: White; Lens Size: 1.20mm x 0.80mm; Lens Style: Rectangle with Flat Top; Millicandela Rating: 40mcd; Wavelength - Dominant: 590nm; Part Number: SML-511WWT86; Color: Yellow; ComponentLink1Description: Datasheet; ComponentLink1URL: https://media.digikey.com/pdf/Data%20Sheets/Rohm%20PDFs/SML-51_Series.pdf; ComponentLink2Description: DigiKey Link; ComponentLink2URL: https://www.digikey.com/en/products/detail/rohm-semiconductor/SML-511WWT86/637039; Height (Max): 0.65mm; LastUpdated: 2024-03-11 7:53:23 AM; Lens Transparency: Diffused; Lifecycle Status: Active; Minimum Order: 1; Mounting Type: Surface Mount; Package / Case: 0603 (1608 Metric); Packaging: TapeAndReel; PartId: 1184; Part Status: Active; Price: 0.10; Series: -; Size / Dimension: 1.60mm L x 0.80mm W; Supplier 1: DigiKey; Supplier Part Number 1: 511-1311-1-ND; Supplier Device Package: 1608 (0603); Value: Yellow
D6 = SML-D12U1WT86: LED RED DIFFUSED 1608 SMD; Manufacturer: Rohm Semiconductor; Configuration: Standard; Current - Test: 20mA; Lens Color: White; Lens Size: 1.20mm x 0.80mm; Lens Style: Rectangle with Flat Top; Millicandela Rating: 63mcd; Wavelength - Dominant: 620nm; Part Number: SML-D12U1WT86; Color: Red; ComponentLink1Description: Datasheet; ComponentLink1URL: https://www.rohm.com/datasheet/SML-D12U1W; ComponentLink2Description: DigiKey Link; ComponentLink2URL: https://www.digikey.com/en/products/detail/rohm-semiconductor/SML-D12U1WT86/5843853; Device Package: 0603 (1608 Metric); Height (Max): 0.65mm; LastUpdated: 2024-03-11 7:52:04 AM; Lens Transparency: Diffused; Lifecycle Status: Active; Minimum Order: 1; Mounting Type: Surface Mount; Package / Case: 0603 (1608 Metric); Packaging: TapeAndReel; PartId: 452; Part Status: Active; Price: 0.02; Series: SML-D12; Size / Dimension: 1.60mm L x 0.80mm W; Supplier 1: DigiKey; Supplier Part Number 1: SML-D12U1WT86CT-ND; Value: Red
J4 = CMP-005-000008-4: Connector Header Through Hole 2 position 0.079 (2.00mm); MF: JST Sales America Inc.; SnapEDA_Link: https://www.snapeda.com/parts/B2B-PH-K-S/JST/view-part/?ref=snap; Check_prices: https://www.snapeda.com/parts/B2B-PH-K-S/JST/view-part/?ref=eda; Value: *; Component Type: Standard; Source: B2B-PH-K-S.SchLib; Package: None; Design Item ID: B2B-PH-K-S; MP: B2B-PH-K-S; Pin Count: 2
R11 R12 R15 R18 = ERJ-UP3J151V: as R5 on sheet NC_Circuit; Part Number: ERJ-UP3J151V; ComponentLink1Description: Datasheet; ComponentLink1URL: https://b2b-api.panasonic.eu/file_stream/pids/fileversion/4484; ComponentLink2Description: DigiKey Link; ComponentLink2URL: https://www.digikey.com/en/products/detail/panasonic-electronic-components/ERJ-UP3J151V/12092481; Composition: Thick Film; Device Package: 0603 (1608 Metric); Features: Anti-Sulfur, Automotive AEC-Q200, Pulse Withstanding; Height - Seated (Max): 0.022" (0.55mm); LastUpdated: 2024-02-09 8:41:36 PM; Lifecycle Status: Active; Minimum Order: 1; Number of Terminations: 2; Operating Temperature: -55°C ~ 155°C; Package / Case: 0603 (1608 Metric); Packaging: TapeAndReel; PartId: 63618; Part Status: Active; Price: 0.02; Ratings: AEC-Q200; Series: ERJ-UP3; Size / Dimension: 0.063" L x 0.031" W (1.60mm x 0.80mm); Supplier 1: DigiKey; Supplier Part Number 1: 10-ERJ-UP3J151VCT-ND; Tolerance: ±5%
  R11 R15: Value: 10k Ohms
  R12: Value: 5.9k Ohms
  R18: Value: 75 Ohms
R13 R14 R16 R17 = ERJ-UP3J151V: as R1 on sheet NC_Connectors; Part Number: ERJ-UP3J151V; ComponentLink1Description: Datasheet; ComponentLink1URL: https://b2b-api.panasonic.eu/file_stream/pids/fileversion/4484; ComponentLink2Description: DigiKey Link; ComponentLink2URL: https://www.digikey.com/en/products/detail/panasonic-electronic-components/ERJ-UP3J151V/12092481; Composition: Thick Film; Device Package: 0603 (1608 Metric); Features: Anti-Sulfur, Automotive AEC-Q200, Pulse Withstanding; Height - Seated (Max): 0.022" (0.55mm); LastUpdated: 2024-02-09 8:41:36 PM; Lifecycle Status: Active; Minimum Order: 1; Number of Terminations: 2; Operating Temperature: -55°C ~ 155°C; Package / Case: 0603 (1608 Metric); Packaging: TapeAndReel; PartId: 63618; Part Status: Active; Price: 0.02; Ratings: AEC-Q200; Series: ERJ-UP3; Size / Dimension: 0.063" L x 0.031" W (1.60mm x 0.80mm); Supplier 1: DigiKey; Supplier Part Number 1: 10-ERJ-UP3J151VCT-ND; Tolerance: ±5%
  R13 R14 R16: Value: 470 Ohms; Resistance: 470 Ohms
  R17: Value: 150 Ohms; Resistance: 150 Ohms
TP5 TP6 TP9 = CMP-007-000003-1: as TP1 on sheet NC_Connectors; Component Type: Standard (No BOM); Polarized: *; Manufacturer #1: *; Part Number #1: *; HelpURL: *; Assembly Type: NONE; Source: CEGEP_SHERBROOKE_TGE_LIBRARY.SchLib; Design Item ID: TPO_SMD_ROUND_2MM; Pin Count: 1; Note: *; Value: *; Package: 2 MM ROUND; Power Max: *
U4 = CMP-04917-000099-1: IC REG LINEAR 3.3V 500MA 6SON; Dropout Voltage: 950mV; Quiescent Current: 30uA; Number of Regulators: 1; Number of Pins: 6; Max Operating Temperature: 125°C; RoHS Compliant: Yes; Packaging: Tape and Reel; Mount: Surface Mount; Output Voltage: 3.3V; Min Operating Temperature: -40°C; Lead Free: Lead Free; Output Current: 500mA
U5 = CMP-0133-00054-1: Stand-Alone Linear Li-Ion/Li-Polymer Charge Management Controller with Power-Good Output, 4.2V, 10-Pin DFN, Industrial Temperature, Tape and Reel; PackageVersion: revBB, Aug-2009; PackageDescription: 10-Lead Plastic Dual Flat, No Lead Package (MF) - 3x3x0.9mm Body [DFN]; PackageReference: DFN-MF10; DatasheetVersion: revB, May-2009
U6 = CMP-0062-01644-4: 800mA Low-Dropout Linear Regulator, 4-pin SOT-223, Pb-Free; Manufacturer: Texas Instruments; CompType: LDO IC; PowerWise: N; PackageTopMarking: XYTT*N03A; High-Reliability: Y; PackageDescription: Molded SOT-223, 6.50 x 3.56 x 1.6mm Body, 4 Lead, 2.3mm Pitch; RoHS: Y; ComponentLink1URL: http://www.ti.com/general/docs/lit/getliterature.tsp?genericPartNumber=LM1117-N&fileType=pdf; Code_JEDEC: TO-261-AA; ComponentLink1Description: Datasheet URL; PartNumber: LM1117MPX-ADJ/NOPB; PackageReference: DCY0004A; Code_IPC: SOT223-4; PinCount: 4

## Nets that join several sheets
1V8: NC_Circuit (C9.2 U3.4), NC_Alimentation (C14.2 R17.1 U6.2 U6.4)
3V3: NC_Circuit (13 pins), NC_Alimentation (6 pins)
GND: NC_Connectors (10 pins), NC_Circuit (48 pins), NC_Alimentation (12 pins)
LOAD: NC_Connectors (F1.1), NC_Circuit (C5.2 D3.4), NC_Alimentation (C11.2 TP5.1 U4.4 U4.6)
VBAT: NC_Connectors (IC1.2), NC_Alimentation (5 pins)
VBUS: NC_Connectors (9 pins), NC_Alimentation (5 pins)
D_N: NC_Connectors (D1.4), NC_Circuit (U1.26)
D_P: NC_Connectors (D1.6), NC_Circuit (U1.27)